# Altium schematic sheet Power-Sheet.SchDoc
size A4; SheetNumber: 2; SheetTotal: 8
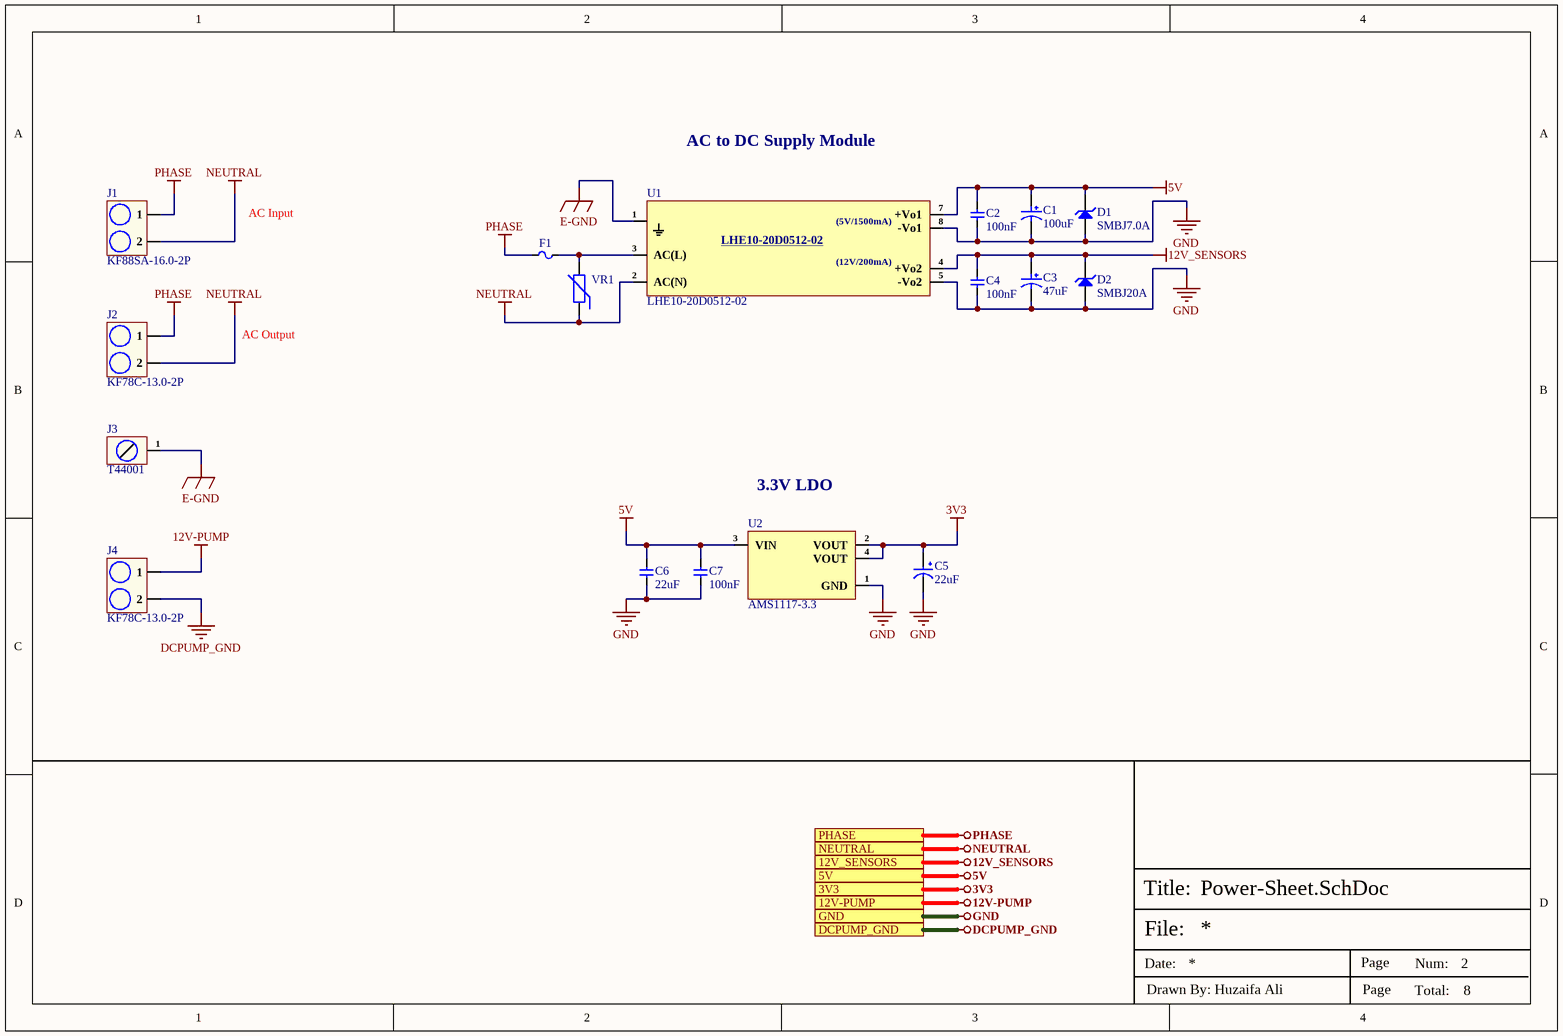
[diagram p0: Power-Sheet.SchDoc]

## Parts
C1  100uF  [25SVPF100M.]
C2  100nF  [Cap-0603]
C3  47uF  [RVT1H470M0607]
C4  100nF  [Cap-0603]
C5  22uF  [Case-B]
C6  22uF  [Cap-0603]
C7  100nF  [Cap-0603]
D1  SMBJ7.0A  [SMB_]
D2  SMBJ20A  [SMB_]
F1  2010T1A250V  [2010T1A250V]  (value not drawn)
J1  KF88SA-16.0-2P  [KF88SA-16.0-2P]
J2  KF78C-13.0-2P  [KF78C-13.0-2P]
J3  T44001  [T44001]
J4  KF78C-13.0-2P  [KF78C-13.0-2P]
U1  LHE10-20D0512-02  [LHE10-20D0512-02]
U2  AMS1117-3.3  [SOT- 223]
VR1  V300LT20AP  [V300LT20AP]  (value not drawn)

## Ports
3V3 (see Top-Sheet[1B], ADC-Sheet[3D], Buttons-Sheet[3D], Controller-Sheet[3D], IO-Expander-Sheet[3D], Sensor-Comms-Sheet[3D]), 5V (see Top-Sheet[1A], ADC-Sheet[3D], Controller-Sheet[3D], Relay-Sheet[3D]), 12V-PUMP (see Top-Sheet[1B], Relay-Sheet[3D]), 12V_SENSORS (see Top-Sheet[1A], Sensor-Comms-Sheet[3D]), DCPUMP_GND (see Top-Sheet[1B], Relay-Sheet[3D]), GND (see Top-Sheet[1A], ADC-Sheet[3D], Buttons-Sheet[3D], Controller-Sheet[3D], IO-Expander-Sheet[3D], Relay-Sheet[3D], Sensor-Comms-Sheet[3D]), NEUTRAL (see Top-Sheet[1A], Relay-Sheet[3D]), PHASE (see Top-Sheet[1B], Relay-Sheet[3D])

## Nets
3V3: C5.1 U2.2(VOUT) U2.4(VOUT) ; port 3V3
5V: C1.1 C2.2 C6.2 C7.2 D1.2(K) U1.7(+Vo1) U2.3(VIN) ; port 5V
12V-PUMP: J4.1 ; port 12V-PUMP
12V_SENSORS: C3.1 C4.2 D2.2(K) U1.4(+Vo2) ; port 12V_SENSORS
DCPUMP_GND: J4.2 ; port DCPUMP_GND
E-GND: J3.1 U1.1
GND: C1.2 C2.1 C3.2 C4.1 C5.2 C6.1 C7.1 D1.1(A) D2.1(A) U1.5(-Vo2) U1.8(-Vo1) U2.1(GND) ; port GND
NEUTRAL: J1.2 J2.2 U1.2(AC(N)) VR1.1 ; port NEUTRAL
PHASE: F1.1 J1.1 J2.1 ; port PHASE
NetF1_2: F1.2 U1.3(AC(L)) VR1.2

## Notes on the sheet
- AC to DC Supply Module
- AC Input
- AC Output
- (near U2) 3.3V LDO
- File:
- Title:
- Date:
- Page
- Num:
- Total:
- Drawn By: Huzaifa Ali
- (in symbol LHE10-20D0512-02) (5V/1500mA); (12V/200mA)

## Library data of the parts
C1 = 25SVPF100M: CAP ALUM POLY 100UF 20% 25V SMD; Manufacturer: Panasonic; Ripple Current: 3.2A; ESR (Equivalent Series Resistance): 24mR; Leakage Current: 500uA; Life (Hours): 5000Hour; Dissipation Factor: 12%; Item Type: Capacitor; Supplier 1: Digi-Key; Manufacturer Part Number: 25SVPF100M; RoHS: Yes; Category: Aluminum Electrolytic Capacitors; Stock 1: 5809; Pricing 1: 1=1.68000, 10=1.32800, 50=1.15080, 100=0.99590, 500=0.75246 (USD); Mount: Surface Mount; Case/Package: Radial; Number of Pins: 7; Min Operating Temperature: -55°C; Max Operating Temperature: 105°C; Capacitance: 100uF; Tolerance: 20%; Voltage Rating: 25V; Ripple Current (AC): 3.2A; Packaging: Tape and Reel; Package Quantity: 1000; Voltage Rating (DC): 25V; Termination: SMD/SMT; Voltage: 25V; Series: OS-CON, SVPF; Diameter: 8mm; Length: 6.9mm; Height: 6.9mm; Height - Seated (Max): 0.276inch; Reach SVHC Compliant: Yes; Lead Free: Lead Free; RoHS Compliant: Yes; ComponentLink1URL: https://datasheet.ciiva.com/25746/1734360-25746518.pdf?src-supplier=Farnell; ComponentLink1Description: https://datasheet.ciiva.com/25746/1734360-25746518.pdf?src-supplier=Farnell; ComponentLink2URL: https://datasheet.ciiva.com/22746/1734360-22746213.pdf?src-supplier=Element14; ComponentLink2Description: https://datasheet.ciiva.com/22746/1734360-22746213.pdf?src-supplier=Element14; ComponentLink3URL: https://datasheet.ciiva.com/24064/svpf-os-262415-24064540.pdf?src-supplier=Mouser; ComponentLink3Description: https://datasheet.ciiva.com/24064/svpf-os-262415-24064540.pdf?src-supplier=Mouser; Supplier Part Number 1: P123675CT-ND; LCSC Part Number: C136279
C2 C4 C7 = CC0603KRX5R9BB104: CAP CER 0.1UF 50V X5R 0603; Manufacturer: Yageo; Tolerance: 10%; Item Type: Capacitor; Supplier 1: Digi-Key; Manufacturer Part Number: CC0603KRX5R9BB104; RoHS: Yes; Category: Ceramic Capacitors; Stock 1: 152253; Pricing 1: 1=0.10000, 10=0.05200, 50=0.02820, 100=0.02310, 500=0.01648, 1000=0.01294 (USD); Mount: Surface Mount; Case/Package: 0603; Case Code (Imperial): 0603; Case Code (Metric): 1608; Weight: 7.1E-05oz; Min Operating Temperature: -55°C; Max Operating Temperature: 85°C; Capacitance: 100nF; Packaging: Tape and Reel; Voltage Rating: 50V; Dielectric: X5R; Termination: SMD/SMT; Voltage Rating (DC): 50V; Package Quantity: 4000; Length: 0.063inch; Width: 0.031inch; Thickness: 0.035inch; Lead Free: Lead Free; Halogen Free: Halogen Free; ComponentLink1URL: http://www.mouser.com/ds/2/447/Yageo_UPY-GP_NP0_16V-to-50V_9-358835.pdf?src-supplier=Mouser; ComponentLink1Description: http://www.mouser.com/ds/2/447/Yageo_UPY-GP_NP0_16V-to-50V_9-358835.pdf?src-supplier=Mouser; ComponentLink2URL: https://www.yageo.com/upload/media/product/productsearch/datasheet/mlcc/UPY-GPHC_X5R_4V-to-50V_26.pdf?src-supplier=Digi-Key; ComponentLink2Description: https://www.yageo.com/upload/media/product/productsearch/datasheet/mlcc/UPY-GPHC_X5R_4V-to-50V_26.pdf?src-supplier=Digi-Key; ComponentLink3URL: http://www.yageo.com/exep/pages/download/literatures/ProductSelectionGuide%202014_Final_2.pdf?src-supplier=Digi-Key; ComponentLink3Description: http://www.yageo.com/exep/pages/download/literatures/ProductSelectionGuide%202014_Final_2.pdf?src-supplier=Digi-Key; Supplier Part Number 1: 311-4046-1-ND; LCSC Part Number: C110022
C3 = RVT1H470M0607: 47uF 50V 66mA@120Hz ±20% SMD,D6.3xL7.7mm Aluminum Electrolytic Capacitors - SMD ROHS; Manufacturer: ROQANG; Manufacturer Part Number: RVT1H470M0607; Package: SMD,D6.3xL7.7mm; LCSC Part Number: C72523; Item Type: Capacitor; ComponentLink1Description: LCSC; ComponentLink1URL: https://www.lcsc.com/product-detail/Aluminum-Electrolytic-Capacitors-SMD_ROQANG-RVT1H470M0607_C72523.html
C5 = TAJB226K016RNJ: CAP TANT 22UF 10% 16V 1411; Manufacturer: Kyocera AVX; Item Type: Tantalum Capacitor; Manufacturer Part Number: TAJB226K016RNJ; Package: CASE-B-3528; LCSC Part Number: C8020; ComponentLink1Description: LCSC; ComponentLink1URL: https://www.lcsc.com/product-detail/Tantalum-Capacitors_Kyocera-AVX-TAJB226K016RNJ_C8020.html
C6 = CC0603MRX5R6BB226: CAP CER 22UF 10V X5R 0603; Manufacturer: Yageo; Tolerance: 20%; Item Type: Capacitor; Supplier 1: Digi-Key; Manufacturer Part Number: CC0603MRX5R6BB226; RoHS: Yes; Category: Ceramic Capacitors; Stock 1: 19628; Pricing 1: 1=0.68000, 10=0.48000, 50=0.36300, 100=0.31610, 500=0.23416, 1000=0.19903 (USD); Mount: Surface Mount; Case/Package: 0603; Case Code (Metric): 1608; Case Code (Imperial): 0603; Weight: 7.1E-05oz; Min Operating Temperature: -55°C; Max Operating Temperature: 85°C; Packaging: Tape and Reel; Capacitance: 22uF; Voltage Rating: 10V; Dielectric: X5R; Termination: SMD/SMT; Voltage Rating (DC): 10V; Package Quantity: 4000; Length: 0.063inch; Width: 0.8mm; Height: 0.8mm; Thickness: 0.035inch; Lead Free: Lead Free; Halogen Free: Halogen Free; RoHS Compliant: Yes; ComponentLink1URL: http://www.mouser.com/ds/2/447/Yageo_UPY-GP_NP0_16V-to-50V_9-358835.pdf?src-supplier=Mouser; ComponentLink1Description: http://www.mouser.com/ds/2/447/Yageo_UPY-GP_NP0_16V-to-50V_9-358835.pdf?src-supplier=Mouser; ComponentLink2URL: http://www.yageo.com/documents/recent/UPY-GPHC_X5R_4V-to-50V_25.pdf?src-supplier=Digi-Key; ComponentLink2Description: http://www.yageo.com/documents/recent/UPY-GPHC_X5R_4V-to-50V_25.pdf?src-supplier=Digi-Key; Supplier Part Number 1: 311-1819-1-ND; LCSC Part Number: C109447
D1 = SMBJ7.0A: 50A 600W 12V 7.78V 7V SMB Electrostatic and Surge Protection (TVS/ESD) ROHS; Manufacturer: Slkor; Manufacturer Part Number: SMBJ7.0A; Package: SMB; LCSC Part Number: C3019967; Item Type: (TVS/ESD); ComponentLink1Description: LCSC; ComponentLink1URL: https://www.lcsc.com/product-detail/Electrostatic-and-Surge-Protection-TVS-ESD_Slkor-SLKORMICRO-Elec-SMBJ7-0A_C3019967.html
D2 = SMBJ20A: 18.5A 32.4V 22.2V 20V DO-214AA Electrostatic and Surge Protection (TVS/ESD) ROHS; Manufacturer: Slkor; Manufacturer Part Number: SMBJ20A; Package: DO-214AA; LCSC Part Number: C2760886; Item Type: (TVS/ESD); ComponentLink1Description: LCSC; ComponentLink1URL: https://www.lcsc.com/product-detail/Electrostatic-and-Surge-Protection-TVS-ESD_Slkor-SLKORMICRO-Elec-SMBJ20A_C2760886.html
F1 = 2010T1A250V: 1A Plugin Fuses ROHS; Manufacturer: Walter Elec; Item Type: Fuse; Manufacturer Part Number: 2010T1A250V; Package: Plugin; LCSC Part Number: C354900; ComponentLink1Description: LCSC; ComponentLink1URL: https://www.lcsc.com/product-detail/Fuses_Walter-Elec-2010T1A250V_C354900.html
J1 = KF88SA-16.0-2P: 1x2P Barrier Block 2 1 16mm -40℃~+105℃ 76A 1kV Black 6~14 Straight pin 16 Plugin,P=16mm Barrier Terminal Blocks ROHS; Manufacturer: CiXi KaiFeng Electronics; Supplier: LCSC; LCSC Part Number: C707749; Manufacturer Part Number: KF88SA-16.0-2P; RoHS: No; Item Type: Terminal Block; ComponentLink1Description: LCSC; ComponentLink1URL: https://www.lcsc.com/product-detail/Barrier-Terminal-Blocks_Cixi-Kefa-Elec-KF88SA-16-0-2P_C707749.html
J2 J4 = KF78C-13.0-2P: 1x2P Midfoot Barrier Block 2 1 13mm 40A -40℃~+105℃ 750V Black 10~18 Straight pin 6 Plugin,P=13mm Barrier Terminal Blocks ROHS; Manufacturer: CiXi KaiFeng Electronics; Supplier: LCSC; LCSC Part Number: C707721; Manufacturer Part Number: KF78C-13.0-2P; RoHS: No; Item Type: Terminal Block
J3 = T44001: M4 Plugin PCB Welding Terminal ROHS; Manufacturer: XFCN; Manufacturer Part Number: T44001; Package: Plugin; ComponentLink1Description: LCSC; ComponentLink1URL: *
U1 = LHE10-20D0512-02: Power supply module ROHS; Manufacturer: LZTEC; Manufacturer Part Number: LHE10-20D0512-02; Package: Custom; LCSC Part Number: C19192878; Item Type: Module; ComponentLink1Description: LCSC; ComponentLink1URL: https://www.lcsc.com/product-detail/Power-supply-module_LZTEC-LHE10-20D0512-02_C19192878.html
U2 = AMS1117-3.3: SOT-223 Linear Voltage Regulators (LDO) ROHS; Manufacturer: GUOXIN JIAPIN SEMICONDUCTOR; Item Type: IC; Manufacturer Part Number: AMS1117-3.3; Package: SOT-223; LCSC Part Number: C2992570; ComponentLink1Description: LCSC; ComponentLink1URL: https://www.lcsc.com/product-detail/Linear-Voltage-Regulators-LDO_GUOXIN-JIAPIN-SEMICONDUCTOR-AMS1117-3-3_C2992570.html
VR1 = V300LT20AP: 775V 405V 300V 470V Plugin Varistors ROHS; Manufacturer: Littelfuse; Supplier: Digikey; LCSC Part Number: C179067; Manufacturer Part Number: V300LT20AP; RoHS: Yes; Item Type: Varistors; Stock: 3169; Pricing: 1=0.45, 10=0.398, 25=0.3736, 100=0.3048 (USD); ComponentLink1URL: https://datasheet.ciiva.com/4541/littelfuse-mov-la-34212-4541978.pdf?src-supplier=Mouser; ComponentLink1Description: https://datasheet.ciiva.com/4541/littelfuse-mov-la-34212-4541978.pdf?src-supplier=Mouser; ComponentLink2URL: https://datasheet.ciiva.com/367/littelfuse-mov-la-367663.pdf?src-supplier=Digikey; ComponentLink2Description: https://datasheet.ciiva.com/367/littelfuse-mov-la-367663.pdf?src-supplier=Digikey